# Altium schematic sheet Discharge.SchDoc
size A4; SheetNumber: 1; SheetTotal: 1
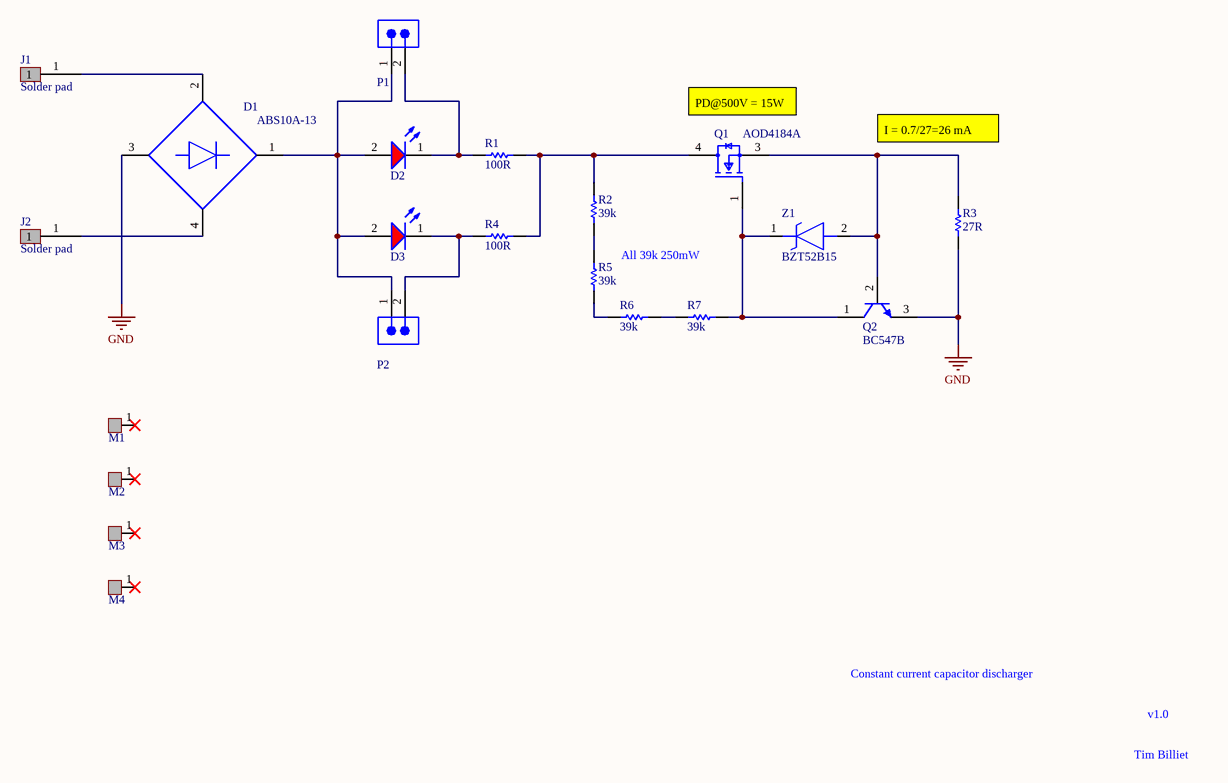
[diagram p0: Discharge.SchDoc]

## Parts
D1  ABS10A-13  [Yangjie ABS10]
D2  Red, 2V, 140°  [Wurth 0603 LED]  (value not drawn)
D3  Red, 2V, 140°  [Wurth 0603 LED]  (value not drawn)
J1  Solder pad  [Solder Pad 3X5MM]
J2  Solder pad  [Solder Pad 3X5MM]
M1  Mounting hole  [M3 hole]  (value not drawn)
M2  Mounting hole  [M3 hole]  (value not drawn)
M3  Mounting hole  [M3 hole]  (value not drawn)
M4  Mounting hole  [M3 hole]  (value not drawn)
P1  61300211121  [2x1 2.54mm F]  (value not drawn)
P2  61300211121  [2x1 2.54mm F]  (value not drawn)
Q1  AOD4184A  [FP-TO252-MFG]
Q2  BC547B  [ONSC-TO-92-3-29-11]
R1  value 100R  [Wurth 0603 Resistor bigger]  (hidden comment: Resistor 100R 0603)
R2  value 39k  [wurth 0805 Resistor]  (hidden comment: Resistor 39k 0805)
R3  value 27R  [Wurth 0603 Resistor bigger]  (hidden comment: Resistor 27R 0603)
R4  value 100R  [Wurth 0603 Resistor bigger]  (hidden comment: Resistor 100R 0603)
R5  value 39k  [wurth 0805 Resistor]  (hidden comment: Resistor 39k 0805)
R6  value 39k  [wurth 0805 Resistor]  (hidden comment: Resistor 39k 0805)
R7  value 39k  [wurth 0805 Resistor]  (hidden comment: Resistor 39k 0805)
Z1  BZT52B15  [Yongyutai SOD-123]

## Nets
GND: D1.3(-) Q2.3(E) R3.1
NetD1_1: D1.1(+) D2.2(A) D3.2(A) P1.1 P2.1
NetD1_2: D1.2(1_~) J1.1
NetD1_4: D1.4(2_~) J2.1
NetD2_1: D2.1(K) P1.2 R1.1
NetD3_1: D3.1(K) P2.2 R4.1
NetQ1_1: Q1.1(G) Q2.1(C) R7.1 Z1.1(K)
NetQ1_3: Q1.3(S) Q2.2(B) R3.2 Z1.2(A)
NetQ1_4: Q1.4(D) R1.2 R2.2 R4.2
NetR2_1: R2.1 R5.2
NetR5_1: R5.1 R6.2
NetR6_1: R6.1 R7.2

Not connected (* = marked no-connect by the designer): M1 1*; M2 1*; M3 1*; M4 1*

## Notes on the sheet
- (near Q1) PD@500V = 15W
- I = 0.7/27=26 mA
- All 39k 250mW
- Constant current capacitor discharger
- v1.0
- Tim Billiet

## Library data of the parts
D1 = Yangjie ABS10 bruggelijkrichter: BRIDGE RECT 1PHASE 1KV 1A
D2 D3 = LED RED 0603: WL-SMCD Mono-color Chip LED Diffused, SMT, size 0603, Red, 2V, 140°; Manufacturer Part Number: 150060RS55040; Manufacturer: Wurth Elektronik; Case/Size Code: 0603; Chip Technology: AlInGaP; Dominant Wavelength: 624nm; Luminous Intensity: 90mcd; Peak Wavelength: 632nm; Category: Signal LEDs; Match Code: WL-SMCD; ComponentLink1Description: Website Link; ComponentLink1URL: https://www.we-online.com/redexpert/article/150060RS55040?ad; ComponentLink2Description: Datasheet Link; ComponentLink2URL: https://www.we-online.com/redexpert/spec/150060RS55040?ad; Mount: Surface Mount; Operating Temperature Max: 85°C; Operating Temperature Min: -40°C; Packaging: Tape and Reel; Length: 1.6mm; Width: 0.8mm; Height: 0.4mm; Emitting Color: Red; Forward Voltage: 2V; Viewing Angle: 140°
P1 P2 = 2P: WR-PHD Pin Header, THT, Vertical, pitch 2.54mm, 1 Row, 2P; Manufacturer: Wurth Elektronik; Contact Resistance: 20mOhm; Rated Current: 3A; Working Voltage: 250V; Withstanding Voltage: 500V; Manufacturer Part Number: 61300211121; Category: Board-to-Board Connectors; Match Code: WR-PHD; ComponentLink1Description: Website Link; ComponentLink1URL: https://www.we-online.com/redexpert/article/61300211121?ad; ComponentLink2Description: Datasheet Link; ComponentLink2URL: https://www.we-online.com/redexpert/spec/61300211121?ad; Mount: Through Hole; Operating Temperature Max: 105°C; Operating Temperature Min: -40°C; Packaging: Bag; Gender: Pin Header; Number of Pins: 2; Number of Rows: 1; Orientation: Vertical; Pitch: 2.54mm
Q1 = CMP-83955-000007-1: MOSFET N-CH 40V 50A TO252; Power Dissipation: 50W; Rds On Max: 7mR; Input Capacitance: 1.8nF; Gate to Source Voltage (Vgs): 20V; Number of Elements: 1; Max Power Dissipation: 2.3W; Min Operating Temperature: -55°C; Drain to Source Voltage (Vdss): 40V; Max Operating Temperature: 175°C; Case/Package: DPAK; Mount: Surface Mount; Continuous Drain Current (ID): 50A; Packaging: Cut Tape; Number of Pins: 3; Radiation Hardening: No
Q2 = CMP-1048-01467-1: Amplifier Transistor, NPN Silicon, 3-Pin TO-92, Bulk Box; Manufacturer: On Semiconductor; IC Continuous (A): 0.1; fT Min (MHz): 150; DatasheetVersion: Rev. 7; ComponentLink1URL: http://www.onsemi.com/; Polarity: NPN; RoHS: FALSE; ComponentLink1Description: Manufacturer URL; Packing: Bulk Box; PackageDescription: 3-Pin Transistor Outline, Body 4.825 x 3.685 mm, Pitch 1.27 mm; ComponentLink3URL: http://www.onsemi.cn/pub_link/Collateral/2N6426-D.PDF; ComponentLink2Description: Datasheet; PackageVersion: Rev. AM; PackageReference: TO-92-3-29-11_AM_SL; ComponentLink3Description: Package Specification; Mounting Technology: Through Hole; PartNumber: BC547B; ComponentLink2URL: http://www.onsemi.com/pub_link/Collateral/BC546-D.PDF
R2 R5-R7 = Resistor 39k 0805 250mW: 250mW
Z1 = BZT52B15: Zener Diode; Manufacturer_Name: Vishay; Manufacturer_Part_Number: BZT52B15-E3-18; Datasheet Link: https://www.vishay.com/docs/85760/bzt52.pdf; Height: 1.35mm; Mouser Part Number: 78-BZT52B15-E3-18; Mouser Price/Stock: https://www.mouser.co.uk/ProductDetail/Vishay-Semiconductors/BZT52B15-E3-18?qs=KP8Io%2FXyE5SvlbRZ336LSg%3D%3D; Arrow Part Number: BZT52B15-E3-18; Arrow Price/Stock: https://www.arrow.com/en/products/bzt52b15-e3-18/vishay?region=nac